# Altium schematic sheet esp32p10displaySheet3.SchDoc
size A4; SheetNumber: 3; SheetTotal: 4
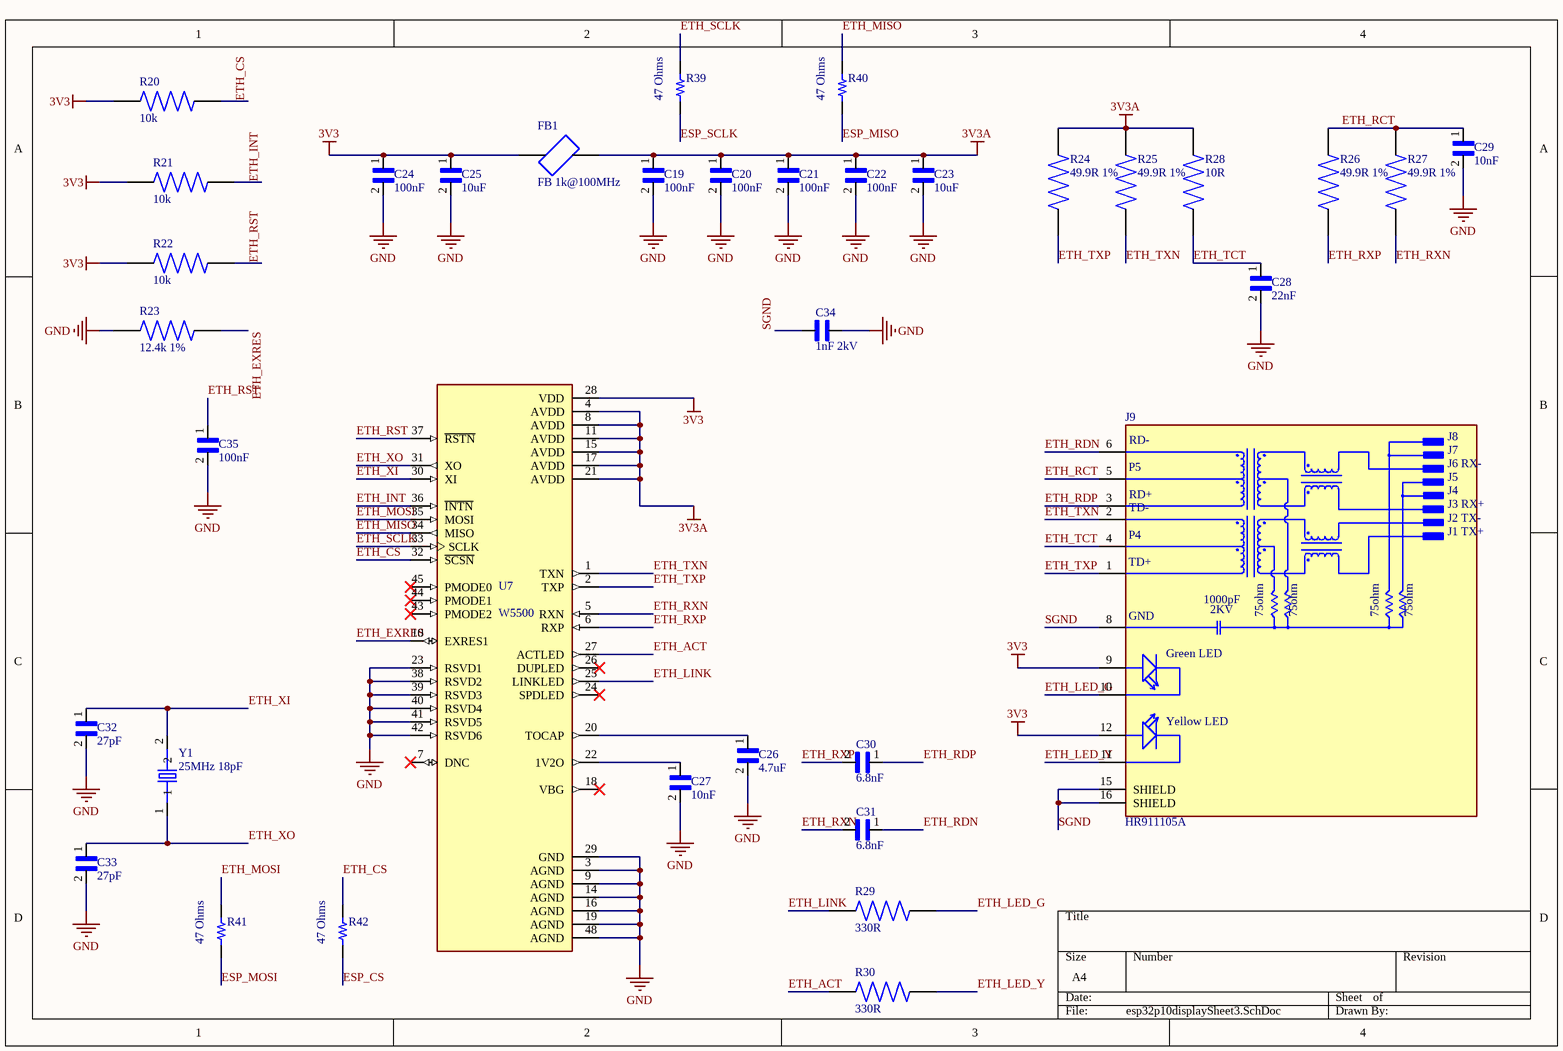
[diagram p0: esp32p10displaySheet3.SchDoc]

## Parts
C19  100nF  [CAPC2012X140N]
C20  100nF  [CAPC2012X140N]
C21  100nF  [CAPC2012X140N]
C22  100nF  [CAPC2012X140N]
C23  10uF  [CAPC2012X140N]
C24  100nF  [CAPC2012X140N]
C25  10uF  [CAPC2012X140N]
C26  4.7uF  [CAPC2012X140N]
C27  10nF  [CAPC2012X140N]
C28  22nF  [CAPC2012X140N]
C29  10nF  [CAPC2012X140N]
C30  6.8nF  [CAPC2012X140N]
C31  6.8nF  [CAPC2012X140N]
C32  27pF  [CAPC2012X140N]
C33  27pF  [CAPC2012X140N]
C34  1nF 2kV  [CAPC3216X175N]
C35  100nF  [CAPC2012X140N]
FB1  FB 1k@100MHz  [BEADC2012X105N]
J9  HR911105A  [HANRUN_HR911105A]
R20  10k  [RES_ERA6VRB1002V]
R21  10k  [RES_ERA6VRB1002V]
R22  10k  [RES_ERA6VRB1002V]
R23  12.4k 1%  [RES_ERA6VRB1002V]
R24  49.9R 1%  [RES_ERA6VRB1002V]
R25  49.9R 1%  [RES_ERA6VRB1002V]
R26  49.9R 1%  [RES_ERA6VRB1002V]
R27  49.9R 1%  [RES_ERA6VRB1002V]
R28  10R  [RES_ERA6VRB1002V]
R29  330R  [RES_ERA6VRB1002V]
R30  330R  [RES_ERA6VRB1002V]
R39  47 Ohms  [RES 0805_2012]
R40  47 Ohms  [RES 0805_2012]
R41  47 Ohms  [RES 0805_2012]
R42  47 Ohms  [RES 0805_2012]
U7  W5500  [QFP50P900X900X160-48N]
Y1  25MHz 18pF  [XTAL1170X500X450]

## Nets
3V3: C24.1 C25.1 FB1.1 J9.9(GA) J9.12(YA) R20.2 R21.2 R22.2 U7.28(VDD)
3V3A: C19.1 C20.1 C21.1 C22.1 C23.1 FB1.2 R24.2 R25.2 R28.2 U7.4(AVDD) U7.8(AVDD) U7.11(AVDD) U7.15(AVDD) U7.17(AVDD) U7.21(AVDD)
GND: C19.2 C20.2 C21.2 C22.2 C23.2 C24.2 C25.2 C26.2 C27.2 C28.2 C29.2 C32.2 C33.2 C34.1 C35.2 R23.1 U7.3(AGND) U7.9(AGND) U7.14(AGND) U7.16(AGND) U7.19(AGND) U7.23(RSVD1) U7.29(GND) U7.38(RSVD2) U7.39(RSVD3) U7.40(RSVD4) U7.41(RSVD5) U7.42(RSVD6) U7.48(AGND)
ESP_CS: R42.1
ESP_MISO: R40.1
ESP_MOSI: R41.1
ESP_SCLK: R39.1
ETH_ACT: R30.1 U7.27(ACTLED)
ETH_CS: R20.1 R42.2 U7.32(~{SCSN})
ETH_EXRES: R23.2 U7.10(EXRES1)
ETH_INT: R21.1 U7.36(~{INTN})
ETH_LED_G: J9.10(GC) R29.2
ETH_LED_Y: J9.11(YC) R30.2
ETH_LINK: R29.1 U7.25(LINKLED)
ETH_MISO: R40.2 U7.34(MISO)
ETH_MOSI: R41.2 U7.35(MOSI)
ETH_RCT: C29.1 J9.5(P5) R26.2 R27.2
ETH_RDN: C31.1 J9.6(RD-)
ETH_RDP: C30.1 J9.3(RD+)
ETH_RST: C35.1 R22.1 U7.37(~{RSTN})
ETH_RXN: C31.2 R27.1 U7.5(RXN)
ETH_RXP: C30.2 R26.1 U7.6(RXP)
ETH_SCLK: R39.2 U7.33(SCLK)
ETH_TCT: C28.1 J9.4(P4) R28.1
ETH_TXN: J9.2(TD-) R25.1 U7.1(TXN)
ETH_TXP: J9.1(TD+) R24.1 U7.2(TXP)
ETH_XI: C32.1 U7.30(XI) Y1.2
ETH_XO: C33.1 U7.31(XO) Y1.1
SGND: C34.2 J9.8(GND) J9.15(SHIELD) J9.16(SHIELD)
NetC26_1: C26.1 U7.20(TOCAP)
NetC27_1: C27.1 U7.22(1V2O)

Not connected (* = marked no-connect by the designer): U7 7(DNC)* 18(VBG)* 24(SPDLED)* 26(DUPLED)* 43(PMODE2)* 44(PMODE1)* 45(PMODE0)*

## Notes on the sheet
- (in symbol HR911105A) J8; J7; J6 RX-; J5; J4; J3 RX+; J2 TX-; J1 TX+; 1000pF; 2KV; 75ohm; Green LED; Yellow LED

## Library data of the parts
C19-C22 C24 C35 = CL21B104KCFNNNE: 0.1 ÂµF Â±10% 100V Ceramic Capacitor X7R 0805 (2012 Metric); MF: Samsung; Purchase-URL: https://pricing.snapeda.com/search?q=CL21B104KCFNNNE&ref=eda; Package: 0805 Samsung; Check_prices: https://www.snapeda.com/parts/CL21B104KCFNNNE/Samsung+Electro-Mechanics/view-part/?ref=eda; Value: *; SnapEDA_Link: https://www.snapeda.com/parts/CL21B104KCFNNNE/Samsung+Electro-Mechanics/view-part/?ref=snap; MP: CL21B104KCFNNNE; Digi-Key_Part_Number: 1276-6840-2-ND
C23 C25 = CL21B104KCFNNNE: 0.1 ÂµF Â±10% 100V Ceramic Capacitor X7R 0805 (2012 Metric); MF: Samsung; MP: CL21A106KOQNNNE; Purchase-URL: https://pricing.snapeda.com/search?q=CL21B104KCFNNNE&ref=eda; Package: 0805 Samsung; Check_prices: https://www.snapeda.com/parts/CL21B104KCFNNNE/Samsung+Electro-Mechanics/view-part/?ref=eda; Value: *; SnapEDA_Link: https://www.snapeda.com/parts/CL21B104KCFNNNE/Samsung+Electro-Mechanics/view-part/?ref=snap; Digi-Key_Part_Number: 1276-6840-2-ND
C26 = CL21B104KCFNNNE: 0.1 ÂµF Â±10% 100V Ceramic Capacitor X7R 0805 (2012 Metric); MF: Samsung; MP: CL21A475KAQNNNE; Purchase-URL: https://pricing.snapeda.com/search?q=CL21B104KCFNNNE&ref=eda; Package: 0805 Samsung; Check_prices: https://www.snapeda.com/parts/CL21B104KCFNNNE/Samsung+Electro-Mechanics/view-part/?ref=eda; Value: *; SnapEDA_Link: https://www.snapeda.com/parts/CL21B104KCFNNNE/Samsung+Electro-Mechanics/view-part/?ref=snap; Digi-Key_Part_Number: 1276-6840-2-ND
C27 C29 = CL21B104KCFNNNE: 0.1 ÂµF Â±10% 100V Ceramic Capacitor X7R 0805 (2012 Metric); MF: Samsung; MP: CL21B103KBANNNC; Purchase-URL: https://pricing.snapeda.com/search?q=CL21B104KCFNNNE&ref=eda; Package: 0805 Samsung; Check_prices: https://www.snapeda.com/parts/CL21B104KCFNNNE/Samsung+Electro-Mechanics/view-part/?ref=eda; Value: *; SnapEDA_Link: https://www.snapeda.com/parts/CL21B104KCFNNNE/Samsung+Electro-Mechanics/view-part/?ref=snap; Digi-Key_Part_Number: 1276-6840-2-ND
C28 = CL21B104KCFNNNE: 0.1 ÂµF Â±10% 100V Ceramic Capacitor X7R 0805 (2012 Metric); MF: Samsung; MP: CL21B223KBANNNC; Purchase-URL: https://pricing.snapeda.com/search?q=CL21B104KCFNNNE&ref=eda; Package: 0805 Samsung; Check_prices: https://www.snapeda.com/parts/CL21B104KCFNNNE/Samsung+Electro-Mechanics/view-part/?ref=eda; Value: *; SnapEDA_Link: https://www.snapeda.com/parts/CL21B104KCFNNNE/Samsung+Electro-Mechanics/view-part/?ref=snap; Digi-Key_Part_Number: 1276-6840-2-ND
C30 C31 = CL21B104KCFNNNE: 0.1 ÂµF Â±10% 100V Ceramic Capacitor X7R 0805 (2012 Metric); MF: Samsung; MP: CL21B682KBANNNC; Purchase-URL: https://pricing.snapeda.com/search?q=CL21B104KCFNNNE&ref=eda; Package: 0805 Samsung; Check_prices: https://www.snapeda.com/parts/CL21B104KCFNNNE/Samsung+Electro-Mechanics/view-part/?ref=eda; Value: *; SnapEDA_Link: https://www.snapeda.com/parts/CL21B104KCFNNNE/Samsung+Electro-Mechanics/view-part/?ref=snap; Digi-Key_Part_Number: 1276-6840-2-ND
C32 C33 = CL21B104KCFNNNE: 0.1 ÂµF Â±10% 100V Ceramic Capacitor X7R 0805 (2012 Metric); MF: Samsung; MP: CL21C270JBANNNC; Purchase-URL: https://pricing.snapeda.com/search?q=CL21B104KCFNNNE&ref=eda; Package: 0805 Samsung; Check_prices: https://www.snapeda.com/parts/CL21B104KCFNNNE/Samsung+Electro-Mechanics/view-part/?ref=eda; Value: *; SnapEDA_Link: https://www.snapeda.com/parts/CL21B104KCFNNNE/Samsung+Electro-Mechanics/view-part/?ref=snap; Digi-Key_Part_Number: 1276-6840-2-ND
C34 = C1206C102KGRACAUTO: 1000 pF Â±10% 2000V (2kV) Ceramic Capacitor X7R 1206 (3216 Metric); MF: KEMET; SnapEDA_Link: https://www.snapeda.com/parts/C1206C102KGRACAUTO/KEMET/view-part/?ref=snap; Package: 3216 KEMET; Value: *; MP: C1206C102KGRACAUTO; Check_prices: https://www.snapeda.com/parts/C1206C102KGRACAUTO/KEMET/view-part/?ref=eda
FB1 = MPZ2012S102AT000: Package: None; Price: None; Value: *; MP: MPZ2012S102AT000; Availability: Unavailable
J9 = HR911105A: DIP RJ45 Connector;; MF: hanrun; SnapEDA_Link: https://www.snapeda.com/parts/HR911105A/HanRun/view-part/?ref=snap; Package: None; MP: HR911105A; Check_prices: https://www.snapeda.com/parts/HR911105A/HanRun/view-part/?ref=eda; Price: None; Value: *; Availability: Not in stock
R20-R22 = ERA6VRB1002V: Availability: Unavailable; Package: None; MP: ERA6VRB1002V; Value: *; Price: None
R23 = ERA6VRB1002V: MP: ERJ-6ENF1242V; Availability: Unavailable; Package: None; Value: *; Price: None
R24-R27 = ERA6VRB1002V: MP: ERJ-6ENF49R9V; Availability: Unavailable; Package: None; Value: *; Price: None
R28 = ERA6VRB1002V: MP: ERJ-6ENF10R0V; Availability: Unavailable; Package: None; Value: *; Price: None
R29 R30 = ERA6VRB1002V: MP: ERJ-6ENF3300V; Availability: Unavailable; Package: None; Value: *; Price: None
R39-R42 = CPF0805B1K0E: RES SMD 47 OHM 1% 1/8W 0805; Part Number: RC0805FR-0747RL; Manufacturer: YAGEO; Power (Watts): 0.1W, 1/10W; Temperature Coefficient: 100ppm/C; Value: 47 Ohms; Composition: Thick Film; Device Package: 0805 (2012 Metric); Height - Seated (Max): 0.026" (0.65mm); Lifecycle Status: Active; Minimum Order: 1; Number of Terminations: 2; Operating Temperature: -55°C ~ 155°C; Package / Case: 0805 (2012 Metric); Packaging: TapeAndReel; Part Status: Active; Resistance: 47 Ohms; Series: RC; Size / Dimension: 0.079" L x 0.049" W (2.00mm x 1.25mm); Supplier Device Package: 0805; Tolerance: 1%
U7 = W5500: Hardwired TCP/IP embedded Ethernet controller; Availability: Unavailable; MP: W5500; Value: *; Price: None; Package: None
Y1 = FOXSDLF/128-20: 12.288 MHz Â±30ppm Crystal 20pF 60 Ohms HC-49/US; MF: Fox Electronics; MP: ECS-250-18-5PX-TR; SnapEDA_Link: https://www.snapeda.com/parts/FOXSDLF/128-20/Fox+Electronics/view-part/?ref=snap; Package: HC49SD Fox Electronics; Value: *; Check_prices: https://www.snapeda.com/parts/FOXSDLF/128-20/Fox+Electronics/view-part/?ref=eda